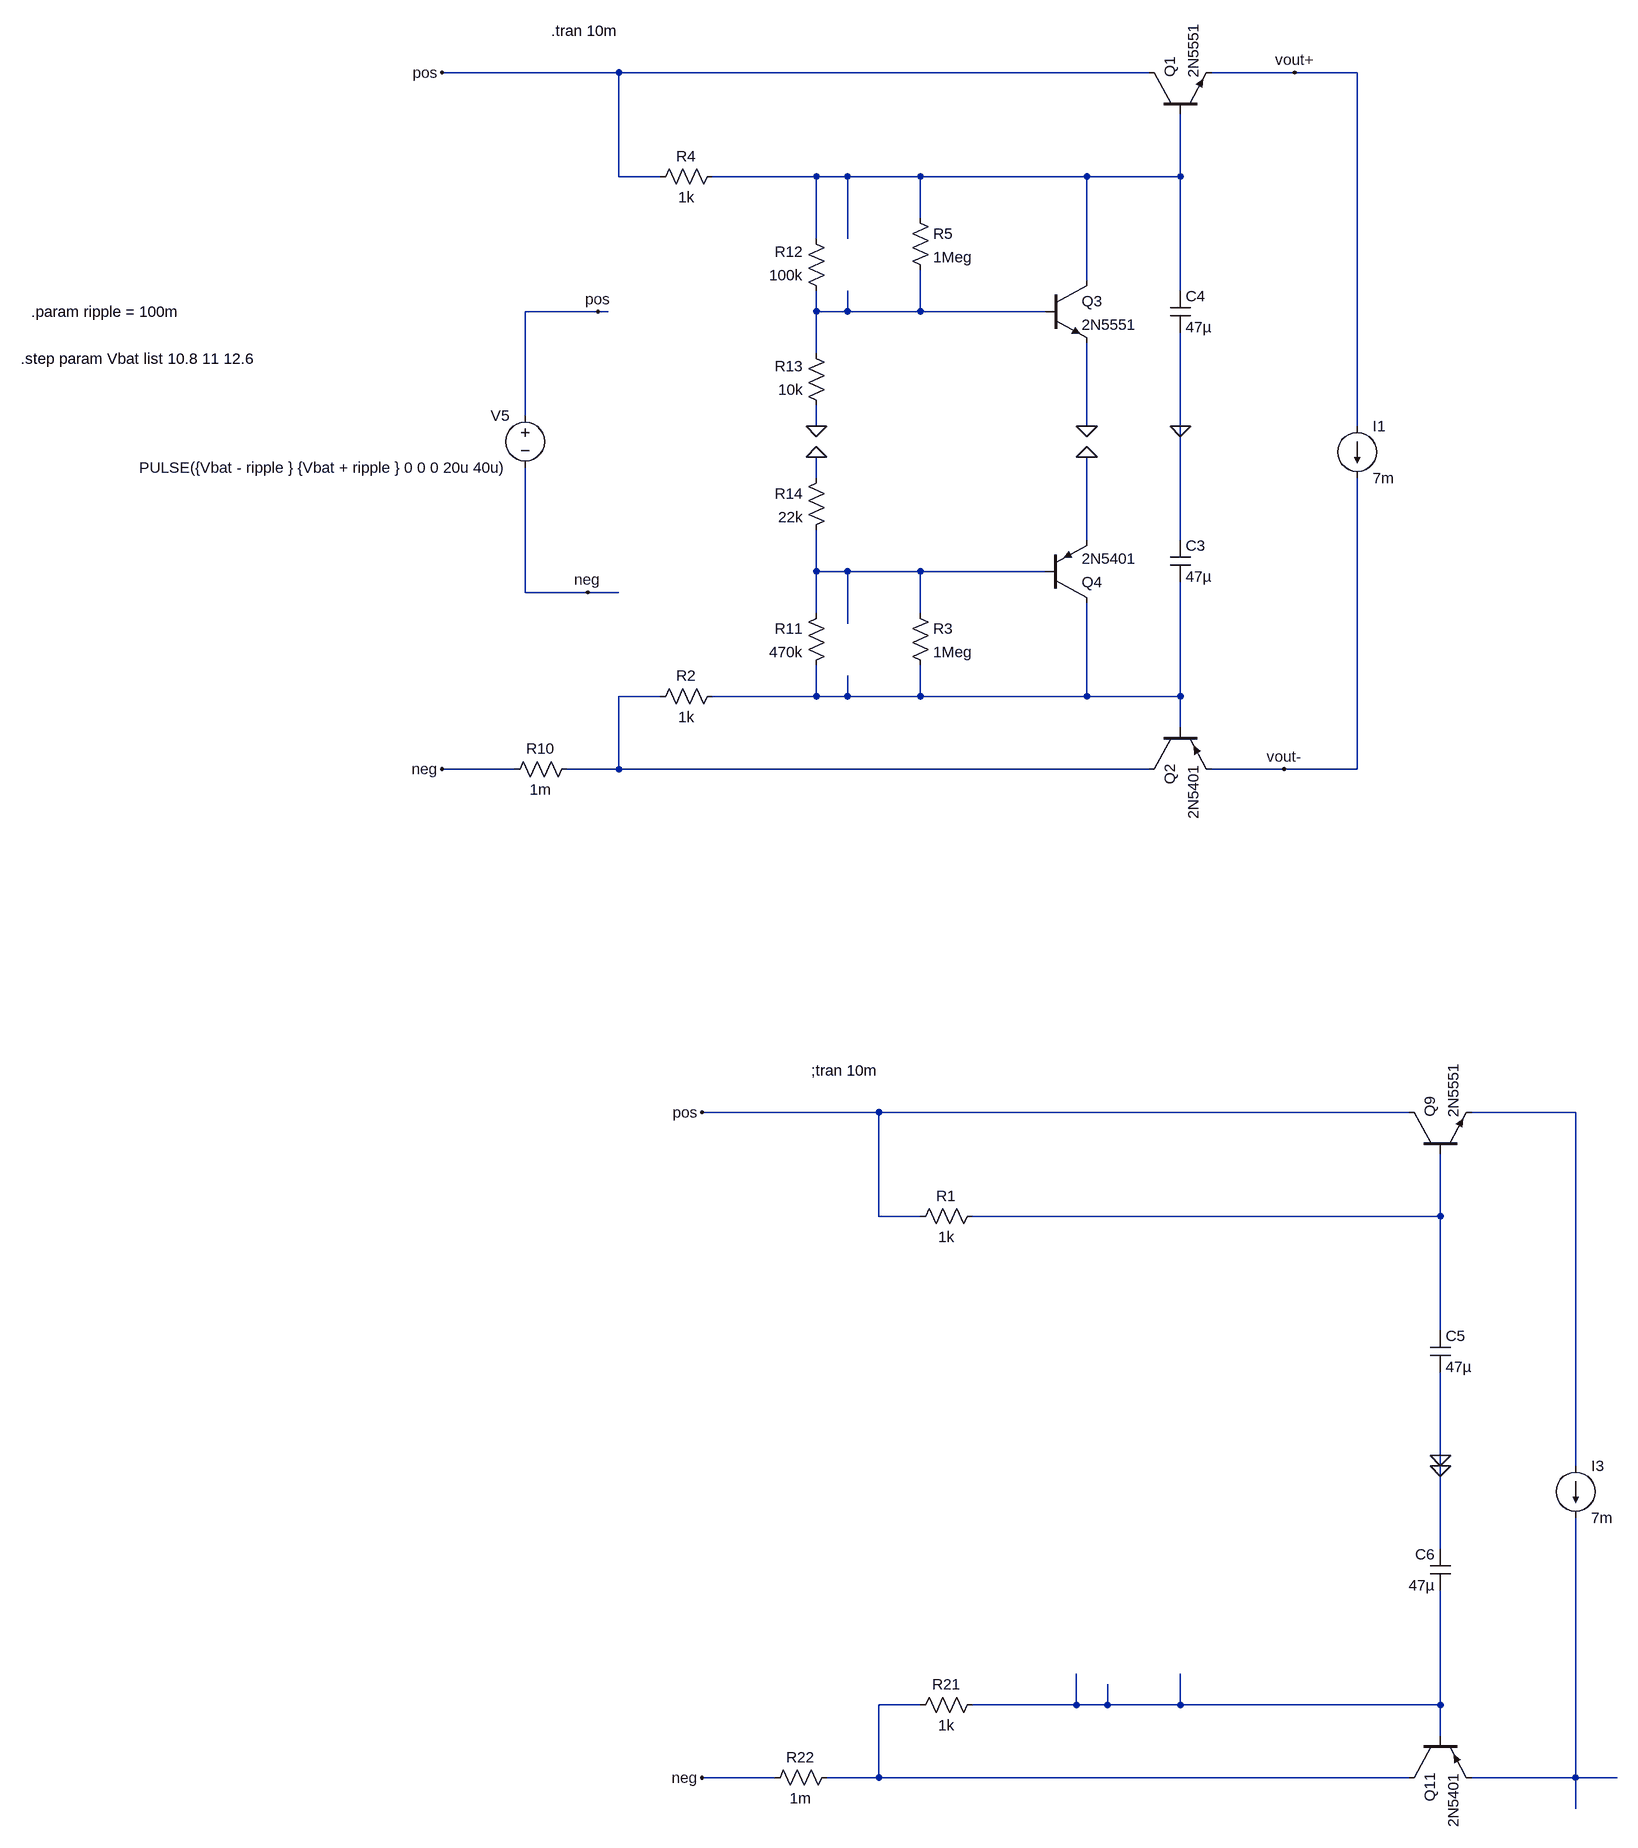
[diagram p0: schematic linear_regulator.asc]
linear_regulator.asc, the LTspice schematic file:
Version 4
SHEET 1 14480 3828
WIRE 3200 112 2928 112
WIRE 4016 112 3200 112
WIRE 4240 112 4112 112
WIRE 4336 112 4240 112
WIRE 3200 272 3200 112
WIRE 3264 272 3200 272
WIRE 3504 272 3344 272
WIRE 3552 272 3504 272
WIRE 3664 272 3552 272
WIRE 3920 272 3664 272
WIRE 4064 272 4064 176
WIRE 4064 272 3920 272
WIRE 3664 336 3664 272
WIRE 3504 368 3504 272
WIRE 3552 368 3552 272
WIRE 3920 432 3920 272
WIRE 4064 448 4064 272
WIRE 3168 480 3056 480
WIRE 3184 480 3168 480
WIRE 3504 480 3504 448
WIRE 3552 480 3552 448
WIRE 3552 480 3504 480
WIRE 3664 480 3664 416
WIRE 3664 480 3552 480
WIRE 3856 480 3664 480
WIRE 3504 544 3504 480
WIRE 3056 640 3056 480
WIRE 3504 656 3504 624
WIRE 3920 656 3920 528
WIRE 4064 656 4064 512
WIRE 4336 656 4336 112
WIRE 3504 736 3504 704
WIRE 3920 832 3920 704
WIRE 4064 832 4064 656
WIRE 3504 880 3504 816
WIRE 3552 880 3504 880
WIRE 3664 880 3552 880
WIRE 3856 880 3664 880
WIRE 3056 912 3056 720
WIRE 3152 912 3056 912
WIRE 3200 912 3152 912
WIRE 3504 944 3504 880
WIRE 3664 944 3664 880
WIRE 3552 960 3552 880
WIRE 3264 1072 3200 1072
WIRE 3504 1072 3504 1024
WIRE 3504 1072 3344 1072
WIRE 3552 1072 3552 1040
WIRE 3552 1072 3504 1072
WIRE 3664 1072 3664 1024
WIRE 3664 1072 3552 1072
WIRE 3920 1072 3920 928
WIRE 3920 1072 3664 1072
WIRE 4064 1072 4064 896
WIRE 4064 1072 3920 1072
WIRE 4064 1120 4064 1072
WIRE 3040 1184 2928 1184
WIRE 3200 1184 3200 1072
WIRE 3200 1184 3120 1184
WIRE 4016 1184 3200 1184
WIRE 4224 1184 4112 1184
WIRE 4336 1184 4336 736
WIRE 4336 1184 4224 1184
WIRE 3600 1712 3328 1712
WIRE 4416 1712 3600 1712
WIRE 4672 1712 4512 1712
WIRE 3600 1872 3600 1712
WIRE 3664 1872 3600 1872
WIRE 4464 1872 4464 1776
WIRE 4464 1872 3744 1872
WIRE 4464 2048 4464 1872
WIRE 4464 2240 4464 2112
WIRE 4464 2256 4464 2240
WIRE 4672 2256 4672 1712
WIRE 4464 2384 4464 2256
WIRE 3664 2624 3600 2624
WIRE 3904 2624 3904 2576
WIRE 3904 2624 3744 2624
WIRE 3952 2624 3952 2592
WIRE 3952 2624 3904 2624
WIRE 4064 2624 4064 2576
WIRE 4064 2624 3952 2624
WIRE 4464 2624 4464 2448
WIRE 4464 2624 4064 2624
WIRE 4464 2672 4464 2624
WIRE 3440 2736 3328 2736
WIRE 3600 2736 3600 2624
WIRE 3600 2736 3520 2736
WIRE 4416 2736 3600 2736
WIRE 4672 2736 4672 2336
WIRE 4672 2736 4512 2736
WIRE 4736 2736 4672 2736
WIRE 4672 2784 4672 2736
FLAG 4240 112 vout+
FLAG 4224 1184 vout-
FLAG 2928 112 pos
FLAG 2928 1184 neg
FLAG 4064 656 0
FLAG 3920 656 0
FLAG 3504 656 0
FLAG 3168 480 pos
FLAG 3152 912 neg
FLAG 3504 704 0
FLAG 3920 704 0
FLAG 3328 1712 pos
FLAG 4464 2256 0
FLAG 3328 2736 neg
FLAG 4464 2240 0
SYMBOL voltage 3056 624 M0
WINDOW 123 0 0 Left 0
WINDOW 39 0 0 Left 0
SYMATTR InstName V5
SYMATTR Value PULSE({Vbat - ripple } {Vbat + ripple } 0 0 0 20u 40u)
SYMBOL npn 4016 176 R270
SYMATTR InstName Q1
SYMATTR Value 2N5551
SYMBOL res 3360 1056 R90
WINDOW 0 0 56 VBottom 2
WINDOW 3 32 56 VTop 2
SYMATTR InstName R2
SYMATTR Value 1k
SYMBOL pnp 4016 1120 M90
SYMATTR InstName Q2
SYMATTR Value 2N5401
SYMBOL cap 4048 832 R0
SYMATTR InstName C3
SYMATTR Value 47µ
SYMBOL res 3360 256 R90
WINDOW 0 0 56 VBottom 2
WINDOW 3 32 56 VTop 2
SYMATTR InstName R4
SYMATTR Value 1k
SYMBOL res 3136 1168 R90
WINDOW 0 0 56 VBottom 2
WINDOW 3 32 56 VTop 2
SYMATTR InstName R10
SYMATTR Value 1m
SYMBOL cap 4048 448 R0
SYMATTR InstName C4
SYMATTR Value 47µ
SYMBOL npn 3856 432 R0
SYMATTR InstName Q3
SYMATTR Value 2N5551
SYMBOL res 3520 464 R180
WINDOW 0 36 76 Left 2
WINDOW 3 36 40 Left 2
SYMATTR InstName R12
SYMATTR Value 100k
SYMBOL res 3520 640 R180
WINDOW 0 36 76 Left 2
WINDOW 3 36 40 Left 2
SYMATTR InstName R13
SYMATTR Value 10k
SYMBOL pnp 3856 928 M180
SYMATTR InstName Q4
SYMATTR Value 2N5401
SYMBOL res 3520 928 M0
SYMATTR InstName R11
SYMATTR Value 470k
SYMBOL res 3520 720 M0
SYMATTR InstName R14
SYMATTR Value 22k
SYMBOL current 4336 656 R0
WINDOW 123 0 0 Left 0
WINDOW 39 0 0 Left 0
SYMATTR InstName I1
SYMATTR Value 7m
SYMBOL res 3648 928 R0
SYMATTR InstName R3
SYMATTR Value 1Meg
SYMBOL res 3648 320 R0
SYMATTR InstName R5
SYMATTR Value 1Meg
SYMBOL npn 4416 1776 R270
SYMATTR InstName Q9
SYMATTR Value 2N5551
SYMBOL res 3760 1856 R90
WINDOW 0 0 56 VBottom 2
WINDOW 3 32 56 VTop 2
SYMATTR InstName R1
SYMATTR Value 1k
SYMBOL cap 4448 2048 R0
SYMATTR InstName C5
SYMATTR Value 47µ
SYMBOL res 3760 2608 R90
WINDOW 0 0 56 VBottom 2
WINDOW 3 32 56 VTop 2
SYMATTR InstName R21
SYMATTR Value 1k
SYMBOL pnp 4416 2672 M90
SYMATTR InstName Q11
SYMATTR Value 2N5401
SYMBOL res 3536 2720 R90
WINDOW 0 0 56 VBottom 2
WINDOW 3 32 56 VTop 2
SYMATTR InstName R22
SYMATTR Value 1m
SYMBOL cap 4480 2448 R180
WINDOW 0 24 56 Left 2
WINDOW 3 24 8 Left 2
SYMATTR InstName C6
SYMATTR Value 47µ
SYMBOL current 4672 2256 R0
WINDOW 123 0 0 Left 0
WINDOW 39 0 0 Left 0
SYMATTR InstName I3
SYMATTR Value 7m
TEXT 3096 48 Left 2 !.tran 10m
TEXT 2280 552 Left 2 !.step param Vbat list 10.8 11 12.6
TEXT 2296 480 Left 2 !.param ripple = 100m
TEXT 3496 1648 Left 2 !;tran 10m

The netlist it stands for:
* linear_regulator.asc
V5 pos neg PULSE({Vbat - ripple } {Vbat + ripple } 0 0 0 20u 40u)
Q1 pos N001 vout+ 0 2N5551
R2 N005 N004 1k
Q2 N004 N005 vout- 0 2N5401
C3 0 N005 47µ
R4 N001 pos 1k
R10 N004 neg 1m
C4 N001 0 47µ
Q3 N001 N002 0 0 2N5551
R12 N002 N001 100k
R13 0 N002 10k
Q4 N005 N003 0 0 2N5401
R11 N003 N005 470k
R14 0 N003 22k
I1 vout+ vout- 7m
R3 N003 N005 1Meg
R5 N001 N002 1Meg
Q9 pos N007 N006 0 2N5551
R1 N007 pos 1k
C5 N007 0 47µ
R21 N009 N008 1k
Q11 N008 N009 N010 0 2N5401
R22 N008 neg 1m
C6 N009 0 47µ
I3 N006 N010 7m
.model NPN NPN
.model PNP PNP
.lib standard.bjt
.tran 10m
.step param Vbat list 10.8 11 12.6
.param ripple = 100m
;tran 10m
.backanno
.end